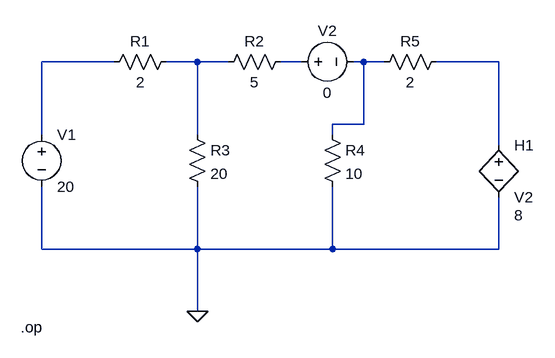
[diagram p0: schematic fase1_ltspice.asc]
fase1_ltspice.asc, the LTspice schematic file:
Version 4.1
SHEET 1 880 680
WIRE 48 -64 -64 -64
WIRE 176 -64 128 -64
WIRE 224 -64 176 -64
WIRE 336 -64 304 -64
WIRE 432 -64 416 -64
WIRE 464 -64 432 -64
WIRE 640 -64 544 -64
WIRE 432 32 432 -64
WIRE 432 32 384 32
WIRE -64 48 -64 -64
WIRE 176 48 176 -64
WIRE 384 48 384 32
WIRE 640 64 640 -64
WIRE -64 224 -64 128
WIRE 176 224 176 128
WIRE 176 224 -64 224
WIRE 384 224 384 128
WIRE 384 224 176 224
WIRE 640 224 640 144
WIRE 640 224 384 224
WIRE 176 320 176 224
FLAG 176 320 0
SYMBOL voltage -64 32 R0
WINDOW 123 0 0 Left 0
WINDOW 39 0 0 Left 0
SYMATTR InstName V1
SYMATTR Value 20
SYMBOL res 144 -80 R90
WINDOW 0 0 56 VBottom 2
WINDOW 3 32 56 VTop 2
SYMATTR InstName R1
SYMATTR Value 2
SYMBOL res 320 -80 R90
WINDOW 0 0 56 VBottom 2
WINDOW 3 32 56 VTop 2
SYMATTR InstName R2
SYMATTR Value 5
SYMBOL res 160 32 R0
SYMATTR InstName R3
SYMATTR Value 20
SYMBOL res 368 32 R0
SYMATTR InstName R4
SYMATTR Value 10
SYMBOL res 560 -80 R90
WINDOW 0 0 56 VBottom 2
WINDOW 3 32 56 VTop 2
SYMATTR InstName R5
SYMATTR Value 2
SYMBOL h 640 48 R0
WINDOW 123 24 124 Left 2
SYMATTR InstName H1
SYMATTR Value V2
SYMATTR Value2 8
SYMBOL voltage 320 -64 R270
WINDOW 0 32 56 VTop 2
WINDOW 3 -32 56 VBottom 2
WINDOW 123 0 0 Left 0
WINDOW 39 0 0 Left 0
SYMATTR InstName V2
SYMATTR Value 0
TEXT -96 344 Left 2 !.op

The netlist it stands for:
* fase1_ltspice.asc
V1 N001 0 20
R1 N002 N001 2
R2 N003 N002 5
R3 N002 0 20
R4 N004 0 10
R5 N005 N004 2
H1 N005 0 V2 8
V2 N003 N004 0
.op
.backanno
.end